# Altium schematic sheet IMU.SchDoc
size A; SheetNumber: 4; SheetTotal: 5
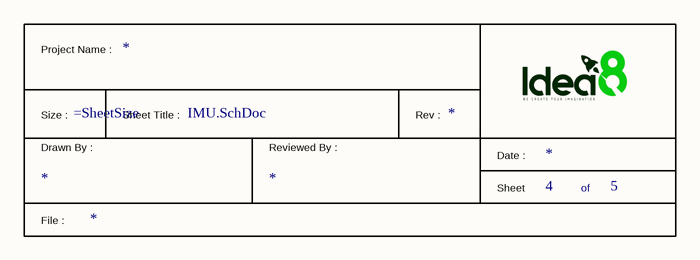
[diagram p0: IMU.SchDoc]

## Parts
*  TitleBlock1  (value not drawn)  (graphical)

## Notes on the sheet
- (in symbol TitleBlock1) Project Name :; Size :; Sheet Title :; Rev :; Drawn By :; Reviewed By :; Date :; Sheet; of; File :